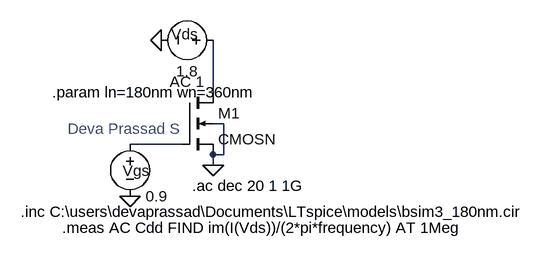
[diagram p0: schematic Cdd.asc]
Cdd.asc, the LTspice schematic file:
Version 4.1
SHEET 1 880 680
WIRE 176 128 176 48
WIRE 192 176 176 176
WIRE 128 208 48 208
WIRE 192 224 192 176
WIRE 192 224 176 224
WIRE 176 240 176 224
FLAG 176 240 0
FLAG 96 48 0
FLAG 48 288 0
SYMBOL nmos4 128 128 R0
SYMATTR InstName M1
SYMATTR Value2 l={ln} w={wn} ad={ln*wn} as={ln*wn} pd={2*ln+wn} ps={2*ln+wn}
SYMATTR Value CMOSN
SYMBOL voltage 192 48 R90
WINDOW 0 6 60 VBottom 2
WINDOW 3 32 56 VTop 2
WINDOW 123 48 56 VTop 2
WINDOW 39 0 0 Left 0
SYMATTR InstName Vds
SYMATTR Value 1.8
SYMATTR Value2 AC 1
SYMBOL voltage 48 192 R0
WINDOW 0 -11 57 Left 2
SYMATTR InstName Vgs
SYMATTR Value 0.9
TEXT -120 312 Left 2 !.inc C:\\users\\devaprassad\\Documents\\LTspice\\models\\bsim3_180nm.cir
TEXT -72 128 Left 2 !.param ln=180nm wn=360nm
TEXT 144 272 Left 2 !.ac dec 20 1 1G
TEXT -56 336 Left 2 !.meas AC Cdd FIND im(I(Vds))/(2*pi*frequency) AT 1Meg
TEXT -48 184 Left 2 ;Deva Prassad S

The netlist it stands for:
* Cdd.asc
M1 N001 N002 0 0 CMOSN l={ln} w={wn} ad={ln*wn} as={ln*wn} pd={2*ln+wn} ps={2*ln+wn}
Vds N001 0 1.8 AC 1
Vgs N002 0 0.9
.model NMOS NMOS
.model PMOS PMOS
.lib standard.mos
.inc C:\users\devaprassad\Documents\LTspice\models\bsim3_180nm.cir
.param ln=180nm wn=360nm
.ac dec 20 1 1G
.meas AC Cdd FIND im(I(Vds))/(2*pi*frequency) AT 1Meg
* Deva Prassad S
.backanno
.end